# Altium project ISM_SDR_PCB.PrjPcb
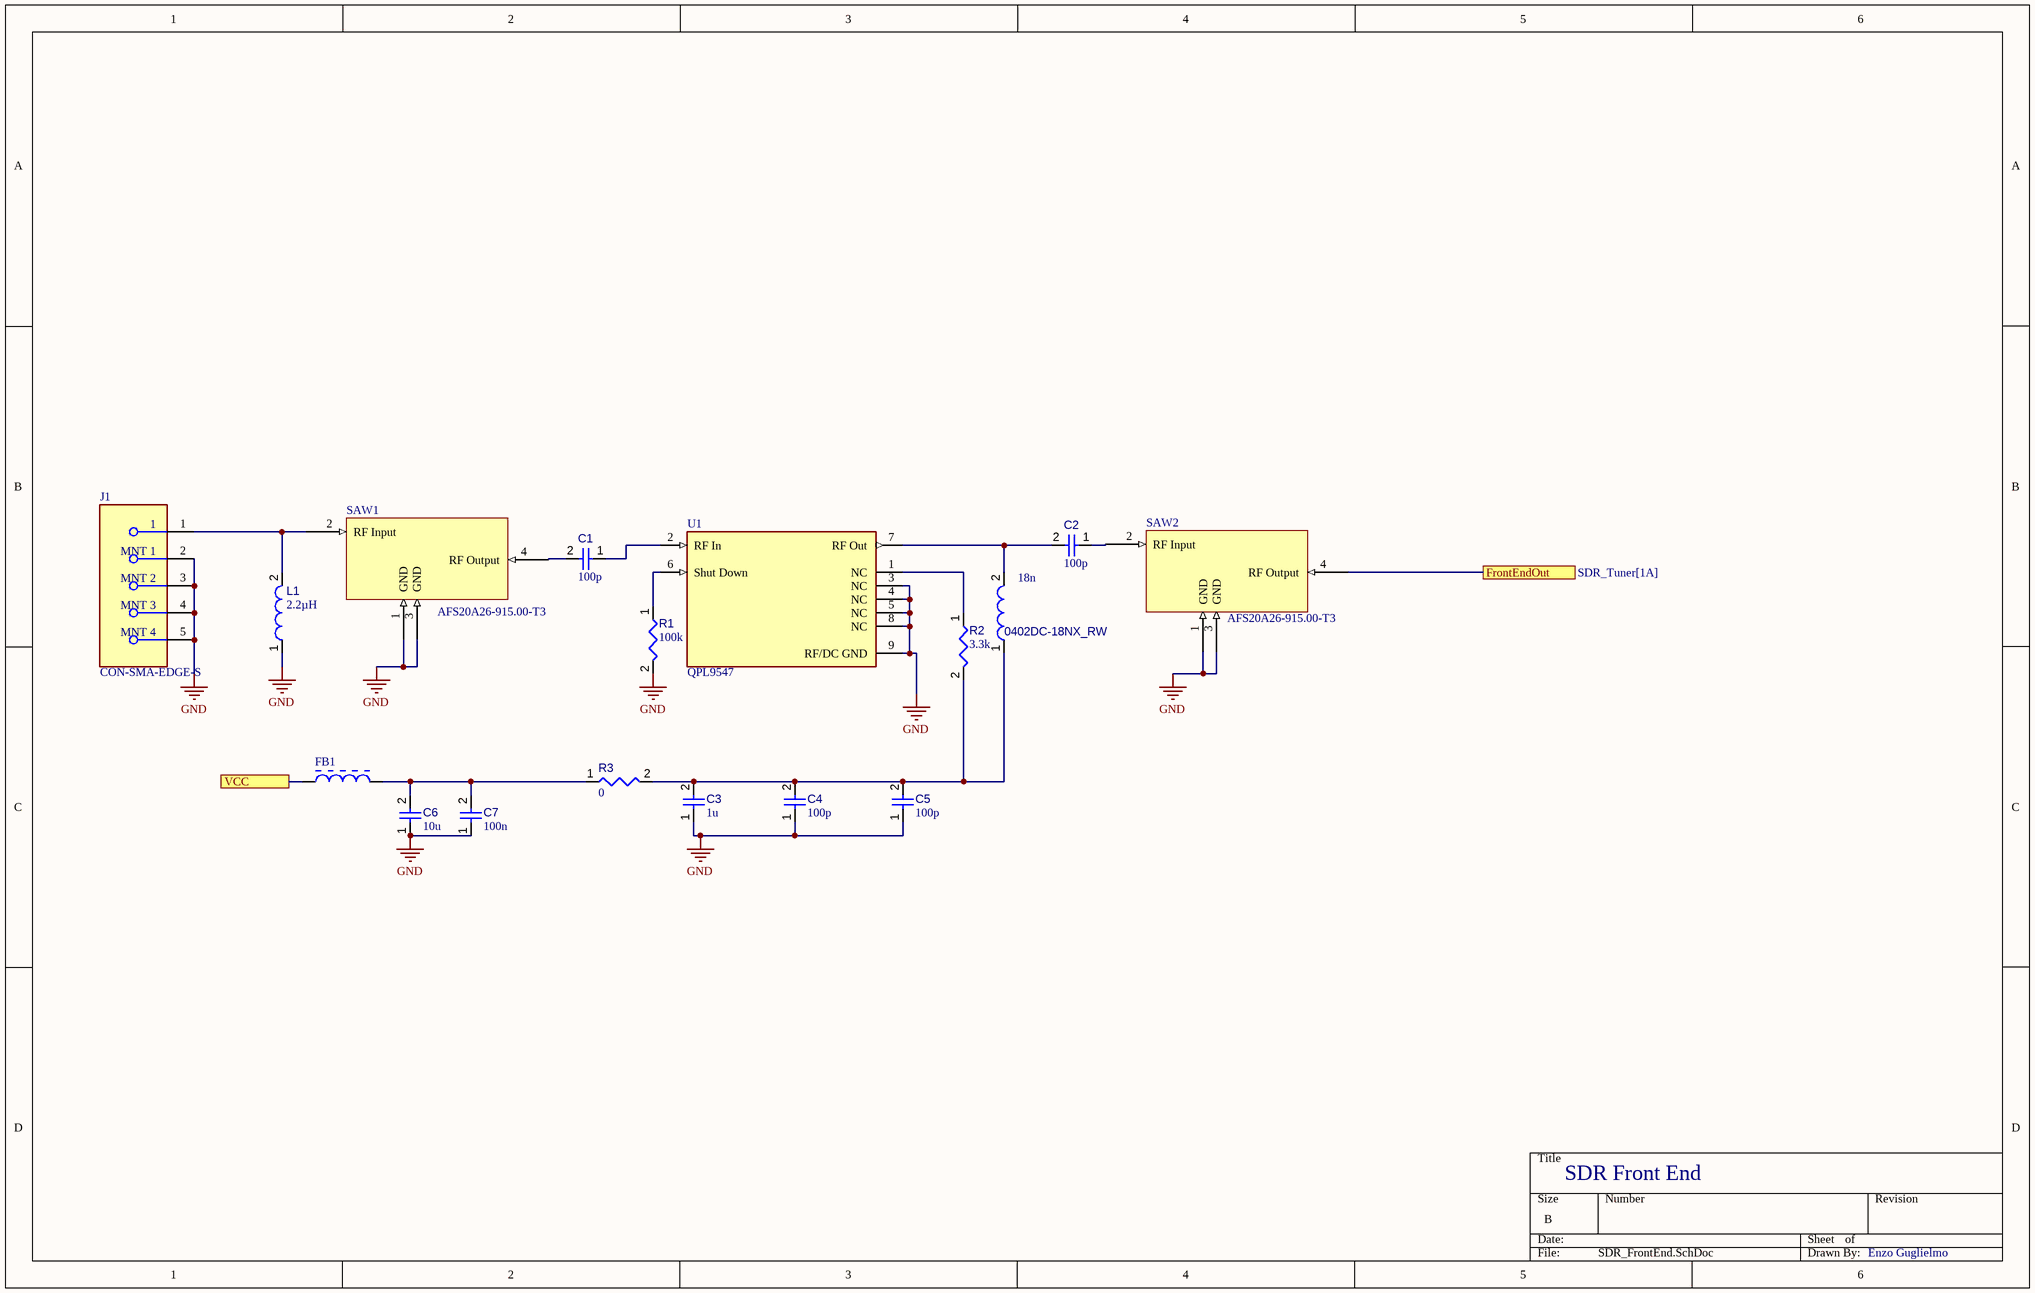
[diagram p0: SDR_FrontEnd.SchDoc]
4 sheets, 139 parts. Net scope: flat (ports and power ports of the same name join across sheets).
Board file: SDR_PCB.PcbDoc
Sheets:
  SDR_FrontEnd.SchDoc
  SDR_LO.SchDoc
  SDR_Tuner.SchDoc
  SDR_Power.SchDoc

## Sheet SDR_FrontEnd.SchDoc
size B; SheetNumber: 1; SheetTotal: 4

### Parts
0402DC-18NX_RW  value 18n  [IND1005X55X20VL5T10]  (hidden comment: ELJ-RF2N2DFB)
C1  value 100p  [CAPC0402(1005)60_L]  (hidden comment: Capacitor 100nF +/-20% 25V 0402)
C2  value 100p  [CAPC0402(1005)60_L]  (hidden comment: Capacitor 100nF +/-20% 25V 0402)
C3  value 1u  [CAPC0402(1005)60_L]  (hidden comment: Capacitor 100nF +/-20% 25V 0402)
C4  value 100p  [CAPC0402(1005)60_L]  (hidden comment: Capacitor 100nF +/-20% 25V 0402)
C5  value 100p  [CAPC0402(1005)60_L]  (hidden comment: Capacitor 100nF +/-20% 25V 0402)
C6  value 10u  [CAPC0402(1005)60_L]  (hidden comment: Capacitor 100nF +/-20% 25V 0402)
C7  value 100n  [CAPC0402(1005)60_L]  (hidden comment: Capacitor 100nF +/-20% 25V 0402)
FB1  BLM21PG331SN1D  [INDC2013X105X50ML20T20]  (value not drawn)
J1  CON-SMA-EDGE-S  [FP-CON-SMA-EDGE-S-MFG]
L1  value 2.2µH  [IND1005X55X20VL5T10]  (hidden comment: ELJ-RF2N2DFB)
R1  value 100k  [RESC1005X40X25ML05T05]  (hidden comment: Resistor 100k +/-1% 0402 63 mW)
R2  value 3.3k  [RESC1005X40X25ML05T05]  (hidden comment: Resistor 100k +/-1% 0402 63 mW)
R3  value 0  [RESC1005X40X25ML05T05]  (hidden comment: Resistor 100k +/-1% 0402 63 mW)
SAW1  AFS20A26-915.00-T3  [AFS20A26-915.00-T3-Footprint-1]
SAW2  AFS20A26-915.00-T3  [AFS20A26-915.00-T3-Footprint-1]
U1  QPL9547  [FP-TQP3M9037-MFG]

### Ports
FrontEndOut (see SDR_Tuner[1A]), VCC (see SDR_Power[1C], SDR_Power[1D], SDR_Power[3A], SDR_Power[3D], SDR_Power[4C], SDR_Tuner[1B])

### Nets
GND: C3.1 C4.1 C5.1 C6.1 C7.1 J1.2(MNT_1) J1.3(MNT_2) J1.4(MNT_3) J1.5(MNT_4) L1.1 R1.2 SAW1.1(GND) SAW1.3(GND) SAW2.1(GND) SAW2.3(GND) U1.3(NC) U1.4(NC) U1.5(NC) U1.8(NC) U1.9(RF/DC_GND)
Net0402DC-18NX_RW_1: 0402DC-18NX_RW.1 C3.2 C4.2 C5.2 R2.2 R3.2
Net0402DC-18NX_RW_2: 0402DC-18NX_RW.2 C2.2 U1.7(RF_Out)
NetC1_1: C1.1 U1.2(RF_In)
NetC1_2: C1.2 SAW1.4(RF_Output)
NetC2_1: C2.1 SAW2.2(RF_Input)
NetC6_2: C6.2 C7.2 FB1.2 R3.1
NetFB1_1: FB1.1 ; port VCC
NetJ1_1: J1.1 L1.2 SAW1.2(RF_Input)
NetR1_1: R1.1 U1.6(Shut_Down)
NetR2_1: R2.1 U1.1(NC)
NetSAW2_4: SAW2.4(RF_Output) ; port FrontEndOut

### Notes on the sheet
- SDR Front End
- Enzo Guglielmo

### Library data of the parts
0402DC-18NX_RW L1 = CMP-006-00006-6: Chip Inductor, 2.2 nH, +/- 0.3 nH, 400 mA, -40 to 85 degC, 0402 (1005 Metric), RoHS, Tape and Reel; Manufacturer: Panasonic; Shielding: Unshielded; Current Rating: 400mA; Tolerance: 5%; Core Material: Ceramic; Q Factor: 8; Datasheet URL: http://www.bourns.com/docs/Product-Datasheets/cm322522.pdf; Case/Package: 0402; RoHS Compliant: True; Package Description: 2-Pin Surface Mount Device, Body 1 x 0.5 mm; Packaging: TapeandReel; Datasheet Version: Sep-12; Package Quantity: 10000; Package Reference: 0402; Min Operating Temperature: -20°C; Mounting Technology: SM; Max Operating Temperature: 85°C
C1-C7 = CMP-001-00065-4: Chip Capacitor, 100nF +/-20%, 25V, 0402, Thickness 0.6 mm; Tolerance: 10%; Max Operating Temperature: 85°C; Min Operating Temperature: -55°C; Pins: 2; Voltage Rating: 25V; Mounting Technology: SMT; Case/Package: 0402
FB1 = CMP-006-00000-3: IND, Chip Ferrite Bead, 330 Ohm, +/- 25%, 1.5 A, -55 to 125 degC, 0805 (2012 Metric), Tape and Reel; Manufacturer: Murata; Current Rating: 1.5A; Impedance: 330Ohm; Resistance: 90mohm; Max Operating Temperature: 125°C; Core Material: Ferrite; Case/Package: 0805; Mounting Technology: SM; Datasheet URL: http://psearch.en.murata.com/inductor/product/LQG15HS15NJ02_.pdf; Packaging: TapeandReel; Min Operating Temperature: -55°C; RoHS Compliant: True; Max Current Rating: 1.5A; Datasheet Version: Nov-11; Package Quantity: 4000; Package Reference: 0805; Package Description: 2-Pin Surface Mount Device, Body 2 x1.25 mm; Tolerance: 25%
J1 = CMP-204357-000001-1: CONN SMA JACK STR EDGE MNT; Manufacturer: RF Solutions Ltd.; Impedance: 50Ω; Conn Orientation: Right Angle; Is Female: yes; Number Of Contacts: 1; Frequency: 18GHz; Shielding: true; Category: Conn; ComponentLink2URL: https://www.rfsolutions.co.uk/downloads/1498648656DS-CON-EDGE-SMA-4.pdf; Octopart: https://octopart.com/con-sma-edge-s-rf+solutions-70967450; Package: CONN_JACK; Manufacturer Part Number: CON-SMA-EDGE-S; Height: 6.35mm; Device Class L1: Connectors; Footprint Url: https://forum.upverter.com/uploads/default/original/3X/b/e/be75b907af57498775929d6d9099689c472e0307.pdf; Contact Material: Gold; ComponentLink2Description: Datasheet; Device Class L2: RF / Coaxial Connectors; RoHS: TRUE; Device Class L3: unset; Digikey Description: CONN SMA JACK STR EDGE MNT; Lead Free: Yes; Automotive: No
R1-R3 = CMP-009-00021-5: Chip Resistor, 100 KOhm, +/- 1%, 0.063 W, -55 to 155 degC, 0402 (1005 Metric); Voltage Rating: 50V; Power: 63mW; Pins: 2; Tolerance: 1%; Max Operating Temperature: 155°C; Case/Package: 0402; Min Operating Temperature: -55°C; Mounting Technology: SM; RoHS Compliant: True
SAW1 SAW2 = CMP-00000-1: Filter Saw 915Mhz 4Smd/Tape & Reel (Tr) Rohs Compliant: Yes; Insertion Loss (dB): 3dB; Number of Circuits: 1; Impedance: 50Ω; Voltage Rating (DC): 3V; Bandwidth: 26MHz; Case/Package: SMD/SMT; Packaging: Tape & Reel (TR); Min Operating Temperature: -30°C; Number of Terminals: 4; Length: 2mm; Mounting Technology: Surface Mount; RoHS: Compliant; Termination: SMD/SMT; Max Operating Temperature: 85°C; Height: 900µm; Frequency: 915MHz; Introduction Date: 2013-01-22; Width: 1.6mm; Cutoff Frequency: 915MHz; REACH SVHC: Unaffected; China RoHS: Compliant; Lifecycle Status: Production
U1 = CMP-231850-000001-1: RF Amp Chip Single GP 2.7GHz 5.25V 8-Pin DFN EP T/R; LCSC: C5185128

## Sheet SDR_LO.SchDoc
size B; SheetNumber: 2; SheetTotal: 4
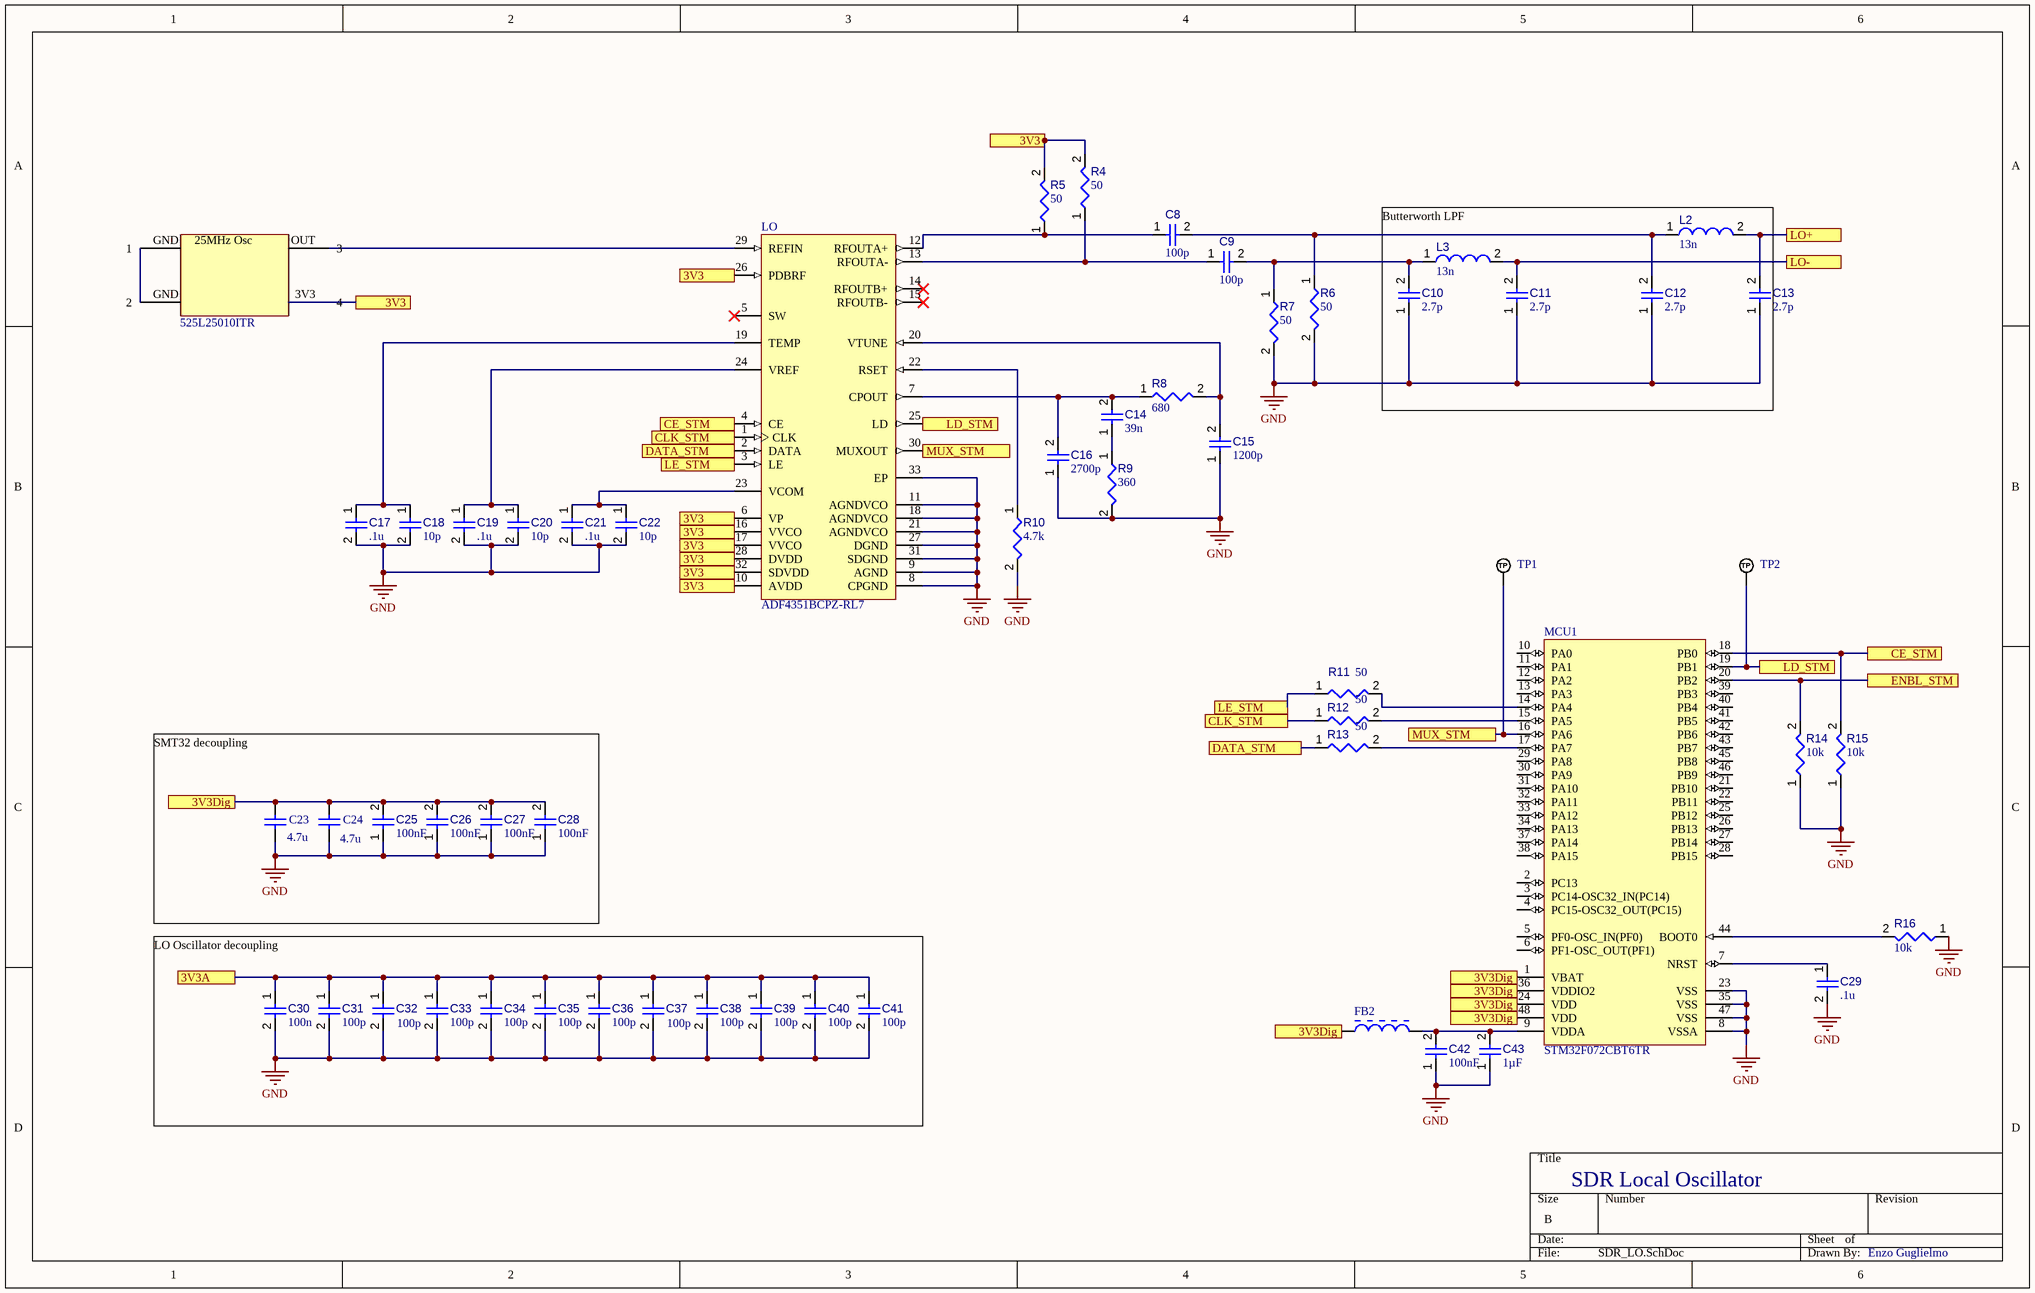
[diagram p1: SDR_LO.SchDoc]

### Parts
*  525L25010ITR
C8  value 100p  [CAPC0402(1005)60_L]  (hidden comment: Capacitor 100nF +/-20% 25V 0402)
C9  value 100p  [CAPC0402(1005)60_L]  (hidden comment: Capacitor 100nF +/-20% 25V 0402)
C10  value 2.7p  [CAPC0402(1005)60_L]  (hidden comment: Capacitor 100nF +/-20% 25V 0402)
C11  value 2.7p  [CAPC0402(1005)60_L]  (hidden comment: Capacitor 100nF +/-20% 25V 0402)
C12  value 2.7p  [CAPC0402(1005)60_L]  (hidden comment: Capacitor 100nF +/-20% 25V 0402)
C13  value 2.7p  [CAPC0402(1005)60_L]  (hidden comment: Capacitor 100nF +/-20% 25V 0402)
C14  value 39n  [CAPC0402(1005)60_L]  (hidden comment: Capacitor 100nF +/-20% 25V 0402)
C15  value 1200p  [CAPC0402(1005)60_L]  (hidden comment: Capacitor 100nF +/-20% 25V 0402)
C16  value 2700p  [CAPC0402(1005)60_L]  (hidden comment: Capacitor 100nF +/-20% 25V 0402)
C17  value .1u  [CAPC0402(1005)60_L]  (hidden comment: Capacitor 100nF +/-20% 25V 0402)
C18  value 10p  [CAPC0402(1005)60_L]  (hidden comment: Capacitor 100nF +/-20% 25V 0402)
C19  value .1u  [CAPC0402(1005)60_L]  (hidden comment: Capacitor 100nF +/-20% 25V 0402)
C20  value 10p  [CAPC0402(1005)60_L]  (hidden comment: Capacitor 100nF +/-20% 25V 0402)
C21  value .1u  [CAPC0402(1005)60_L]  (hidden comment: Capacitor 100nF +/-20% 25V 0402)
C22  value 10p  [CAPC0402(1005)60_L]  (hidden comment: Capacitor 100nF +/-20% 25V 0402)
C23  4.7u  [WCAP-CSGP_0402_L1W0.5H0.5]
C24  4.7u  [WCAP-CSGP_0402_L1W0.5H0.5]
C25  value 100nF  [CAPC0402(1005)60_L]  (hidden comment: Capacitor 100nF +/-20% 10V 0402)
C26  value 100nF  [CAPC0402(1005)60_L]  (hidden comment: Capacitor 100nF +/-20% 10V 0402)
C27  value 100nF  [CAPC0402(1005)60_L]  (hidden comment: Capacitor 100nF +/-20% 10V 0402)
C28  value 100nF  [CAPC0402(1005)60_L]  (hidden comment: Capacitor 100nF +/-20% 10V 0402)
C29  value .1u  [CAPC0402(1005)60_L]  (hidden comment: Capacitor 100nF +/-20% 25V 0402)
C30  value 100n  [CAPC0402(1005)60_L]  (hidden comment: Capacitor 100nF +/-20% 25V 0402)
C31  value 100p  [CAPC0402(1005)60_L]  (hidden comment: Capacitor 100nF +/-20% 25V 0402)
C32  value 100p  [CAPC0402(1005)60_L]  (hidden comment: Capacitor 100nF +/-20% 25V 0402)
C33  value 100p  [CAPC0402(1005)60_L]  (hidden comment: Capacitor 100nF +/-20% 25V 0402)
C34  value 100p  [CAPC0402(1005)60_L]  (hidden comment: Capacitor 100nF +/-20% 25V 0402)
C35  value 100p  [CAPC0402(1005)60_L]  (hidden comment: Capacitor 100nF +/-20% 25V 0402)
C36  value 100p  [CAPC0402(1005)60_L]  (hidden comment: Capacitor 100nF +/-20% 25V 0402)
C37  value 100p  [CAPC0402(1005)60_L]  (hidden comment: Capacitor 100nF +/-20% 25V 0402)
C38  value 100p  [CAPC0402(1005)60_L]  (hidden comment: Capacitor 100nF +/-20% 25V 0402)
C39  value 100p  [CAPC0402(1005)60_L]  (hidden comment: Capacitor 100nF +/-20% 25V 0402)
C40  value 100p  [CAPC0402(1005)60_L]  (hidden comment: Capacitor 100nF +/-20% 25V 0402)
C41  value 100p  [CAPC0402(1005)60_L]  (hidden comment: Capacitor 100nF +/-20% 25V 0402)
C42  value 100nF  [CAPC0402(1005)60_L]  (hidden comment: Capacitor 100nF +/-20% 10V 0402)
C43  value 1µF  [CAPC0402(1005)60_L]  (hidden comment: Capacitor 1µF +/-20% 10V 0402)
FB2  BLM21PG331SN1D  [INDC2013X105X50ML20T20]  (value not drawn)
L2  value 13n  [IND1005X55X20VL5T10]  (hidden comment: ELJ-RF2N2DFB)
L3  value 13n  [IND1005X55X20VL5T10]  (hidden comment: ELJ-RF2N2DFB)
LO  ADF4351BCPZ-RL7  [ADI-CP-32-2_L]
MCU1  STM32F072CBT6TR  [STM-LQFP48_M]
R4  value 50  [RESC1005X40X25ML05T05]  (hidden comment: Resistor 100k +/-1% 0402 63 mW)
R5  value 50  [RESC1005X40X25ML05T05]  (hidden comment: Resistor 100k +/-1% 0402 63 mW)
R6  value 50  [RESC1005X40X25ML05T05]  (hidden comment: Resistor 100k +/-1% 0402 63 mW)
R7  value 50  [RESC1005X40X25ML05T05]  (hidden comment: Resistor 100k +/-1% 0402 63 mW)
R8  value 680  [RESC1005X40X25ML05T05]  (hidden comment: Resistor 100k +/-1% 0402 63 mW)
R9  value 360  [RESC1005X40X25ML05T05]  (hidden comment: Resistor 100k +/-1% 0402 63 mW)
R10  value 4.7k  [RESC1005X40X25ML05T05]  (hidden comment: Resistor 100k +/-1% 0402 63 mW)
R11  value 50  [RESC1005X40X25ML05T05]  (hidden comment: Resistor 100k +/-1% 0402 63 mW)
R12  value 50  [RESC1005X40X25ML05T05]  (hidden comment: Resistor 100k +/-1% 0402 63 mW)
R13  value 50  [RESC1005X40X25ML05T05]  (hidden comment: Resistor 100k +/-1% 0402 63 mW)
R14  value 10k  [RESC1005X40X25ML05T05]  (hidden comment: Resistor 100k +/-1% 0402 63 mW)
R15  value 10k  [RESC1005X40X25ML05T05]  (hidden comment: Resistor 100k +/-1% 0402 63 mW)
R16  value 10k  [RESC1005X40X25ML05T05]  (hidden comment: Resistor 100k +/-1% 0402 63 mW)
TP1  TP_NOBOM  [PAD_RND_1MM]  (value not drawn)  (no BOM)
TP2  TP_NOBOM  [PAD_RND_1MM]  (value not drawn)  (no BOM)

### Ports
3V3 (see SDR_LO[2A], SDR_LO[3A], SDR_LO[3B]), 3V3 (see SDR_LO[3A], SDR_LO[3B]), 3V3A (see SDR_Power[2C]), 3V3Dig (see SDR_LO[1C], SDR_LO[4D], SDR_LO[5D], SDR_Power[2D]), 3V3Dig (see SDR_LO[1C], SDR_LO[5D], SDR_Power[2D]), 3V3Dig (see SDR_LO[4D], SDR_LO[5D], SDR_Power[2D]), CE_STM (see SDR_LO[2B]), CE_STM (see SDR_LO[6C]), CLK_STM (see SDR_LO[2B]), CLK_STM (see SDR_LO[4C]), DATA_STM (see SDR_LO[2B]), DATA_STM (see SDR_LO[4C]), ENBL_STM (see SDR_Tuner[3A]), LD_STM (see SDR_LO[3B]), LD_STM (see SDR_LO[6C]), LE_STM (see SDR_LO[2B]), LE_STM (see SDR_LO[4C]), LO+ (see SDR_Tuner[3A]), LO- (see SDR_Tuner[3A]), MUX_STM (see SDR_LO[3B]), MUX_STM (see SDR_LO[5C])

### Nets
GND: C10.1 C11.1 C12.1 C13.1 C15.1 C16.1 C17.2 C18.2 C19.2 C20.2 C21.2 C22.2 C23.1 C24.1 C25.1 C26.1 C27.1 C28.1 C29.2 C30.2 C31.2 C32.2 C33.2 C34.2 C35.2 C36.2 C37.2 C38.2 C39.2 C40.2 C41.2 C42.1 C43.1 LO.8(CPGND) LO.9(AGND) LO.11(AGNDVCO) LO.18(AGNDVCO) LO.21(AGNDVCO) LO.27(DGND) LO.31(SDGND) LO.33(EP) MCU1.8(VSSA) MCU1.23(VSS) MCU1.35(VSS) MCU1.47(VSS) R6.2 R7.2 R9.2 R10.2 R14.1 R15.1 R16.1
Net*_3V3: *.3V3(4) LO.6(VP) LO.10(AVDD) LO.16(VVCO) LO.17(VVCO) LO.26(PDBRF) LO.28(DVDD) LO.32(SDVDD) R4.2 R5.2 ; port 3V3
NetC8_1: C8.1 LO.12(RFOUTA+) R5.1
NetC8_2: C8.2 C12.2 L2.1 R6.1
NetC9_1: C9.1 LO.13(RFOUTA-) R4.1
NetC9_2: C9.2 C10.2 L3.1 R7.1
NetC11_2: C11.2 L3.2 ; port LO-
NetC13_2: C13.2 L2.2 ; port LO+
NetC14_1: C14.1 R9.1
NetC14_2: C14.2 C16.2 LO.7(CPOUT) R8.1
NetC15_2: C15.2 LO.20(VTUNE) R8.2
NetC17_1: C17.1 C18.1 LO.19(TEMP)
NetC19_1: C19.1 C20.1 LO.24(VREF)
NetC21_1: C21.1 C22.1 LO.23(VCOM)
NetC23_2: C23.2 C24.2 C25.2 C26.2 C27.2 C28.2 FB2.1 MCU1.1(VBAT) MCU1.24(VDD) MCU1.36(VDDIO2) MCU1.48(VDD) ; port 3V3Dig
NetC29_1: C29.1 MCU1.7(NRST)
NetC30_1: C30.1 C31.1 C32.1 C33.1 C34.1 C35.1 C36.1 C37.1 C38.1 C39.1 C40.1 C41.1 ; port 3V3A
NetC42_2: C42.2 C43.2 FB2.2 MCU1.9(VDDA)
NetLO_1: LO.1(CLK) R12.1 ; port CLK_STM
NetLO_2: LO.2(DATA) R13.1 ; port DATA_STM
NetLO_3: LO.3(LE) R11.1 ; port LE_STM
NetLO_4: LO.4(CE) MCU1.18(PB0) R15.2 ; port CE_STM
NetLO_22: LO.22(RSET) R10.1
NetLO_25: LO.25(LD) MCU1.19(PB1) TP2.1(TP) ; port LD_STM
NetLO_30: LO.30(MUXOUT) MCU1.16(PA6) TP1.1(TP) ; port MUX_STM
NetMCU1_14: MCU1.14(PA4) R11.2
NetMCU1_15: MCU1.15(PA5) R12.2
NetMCU1_17: MCU1.17(PA7) R13.2
NetMCU1_20: MCU1.20(PB2) R14.2 ; port ENBL_STM
NetMCU1_44: MCU1.44(BOOT0) R16.2

Not connected (* = marked no-connect by the designer): * GND(2) OUT(3); LO 5(SW)* 14(RFOUTB+)* 15(RFOUTB-)* 29(REFIN); MCU1 2(PC13) 3(PC14-OSC32_IN(PC14)) 4(PC15-OSC32_OUT(PC15)) 5(PF0-OSC_IN(PF0)) 6(PF1-OSC_OUT(PF1)) 10(PA0) 11(PA1) 12(PA2) 13(PA3) 21(PB10) 22(PB11) 25(PB12) 26(PB13) 27(PB14) 28(PB15) 29(PA8) 30(PA9) 31(PA10) 32(PA11) 33(PA12) 34(PA13) 37(PA14) 38(PA15) 39(PB3) 40(PB4) 41(PB5) 42(PB6) 43(PB7) 45(PB8) 46(PB9)

### Notes on the sheet
- Butterworth LPF
- SMT32 decoupling
- LO Oscillator decoupling
- SDR Local Oscillator
- Enzo Guglielmo
- (in symbol 525L25010ITR) 25MHz Osc

### Library data of the parts
* = 525L25010ITR: 25 MHz TCXO Clipped Sine Wave Oscillator 3.3V 4-SMD, No Lead
C8-C22 C29-C41 = CMP-001-00065-4: as C1 on sheet SDR_FrontEnd; Max Operating Temperature: 85°C; Min Operating Temperature: -55°C; Pins: 2; Voltage Rating: 25V; Mounting Technology: SMT; Case/Package: 0402
C23 C24 = CMP-207839-000027-3: Cap, Mlcc, 4.7UF, 6.3V, X5R, 0402 Rohs Compliant: Yes; Insulation Resistance: 20MΩ; Capacitance: 4.7µF; Material: Ceramic; Tolerance: 20%; Case Code (Metric): 1005; Case/Package: 0402; Case Code (Imperial): 0402; RoHS: Compliant; Voltage Rating (DC): 6.3V; Thickness: 558.8µm; Dielectric: X5R; REACH SVHC: Unknown; Voltage Rating: 6.3V; Width: 500µm; Max Operating Temperature: 85°C; Height: 500µm; Mount: Surface Mount; Min Operating Temperature: -55°C; Length: 1mm
C25-C28 C42 = CMP-001-00061-3: Chip Capacitor, 100nF +/-20%, 10V, 0402, Thickness 0.6 mm; Tolerance: 20%; Mounting Technology: SMT; Voltage Rating: 10V; Max Operating Temperature: 85°C; Pins: 2; Case/Package: 0402; Min Operating Temperature: -55°C
C43 = CMP-001-00063-3: Chip Capacitor, 1µF +/-20%, 10V, 0402, Thickness 0.6 mm; Tolerance: 10%; Mounting Technology: SMT; Max Operating Temperature: 85°C; Voltage Rating: 10V; Pins: 2; Case/Package: 0402; Min Operating Temperature: -55°C
FB2 = CMP-006-00000-3: as FB1 on sheet SDR_FrontEnd; Max Operating Temperature: 125°C; Core Material: Ferrite; Case/Package: 0805; Mounting Technology: SM; Datasheet URL: http://psearch.en.murata.com/inductor/product/LQG15HS15NJ02_.pdf; Packaging: TapeandReel; Min Operating Temperature: -55°C; RoHS Compliant: True; Max Current Rating: 1.5A; Datasheet Version: Nov-11; Package Quantity: 4000; Package Reference: 0805; Package Description: 2-Pin Surface Mount Device, Body 2 x1.25 mm; Tolerance: 25%
L2 L3 = CMP-006-00006-6: as 0402DC-18NX_RW on sheet SDR_FrontEnd; Datasheet URL: http://www.bourns.com/docs/Product-Datasheets/cm322522.pdf; Case/Package: 0402; RoHS Compliant: True; Package Description: 2-Pin Surface Mount Device, Body 1 x 0.5 mm; Packaging: TapeandReel; Datasheet Version: Sep-12; Package Quantity: 10000; Package Reference: 0402; Min Operating Temperature: -20°C; Mounting Technology: SM; Max Operating Temperature: 85°C
LO = CMP-0287-00015-1: Wideband Synthesizer with Integrated VCO, CP-32-2, Pb-Free, 1500 Reel; Max RF Input (MHz): 4.4GHz; RF Prescalers: 4/5,8/9; Max REFin (MHz): 250MHz; Frequency Range: 35MHz-4.4GHz; Norm Phase Noise (dBc/Hz): -221dBc; Supply Current: 110mA; Single/Dual: Single; PackageVersion: Jan-2005; ComponentLink3URL: http://www.analog.com/static/imported-files/packages/414143737956480539664569CP_32_2.pdf; PackageReference: CP-32-2; ComponentLink2URL: http://www.analog.com/static/imported-files/data_sheets/ADF4351.pdf; ComponentLink1URL: www.analog.com; ComponentLink1Description: Manufacturer URL; ComponentLink2Description: Datasheet; ComponentLink3Description: Package Specification; PackageDescription: 32-Lead Lead Frame Chip Scale Package [LFCSP_VQ]; DatasheetVersion: Rev. Pr D; Code_JEDEC: MO-220-VHHD-2
MCU1 = CMP-0304-00171-1: ARM Cortex-M0 32-bit MCU, 128 KB Flash, 16 KB Internal RAM, 37 I/Os, 48-Pin LQFP, -40 to 85 degC, Tape and Reel; FLASH Size (Prog) (kB): 128; D/A Converter: 1; Operating Frequency(F) (Processor speed) (MHz): 48; Supply Voltage(Vcc) min (V): 2; I/Os (High Current): 37; Internal RAM Size (kB): 16; ComponentLink1URL: http://www.st.com/; DatasheetVersion: Rev. 5; Mounting Technology: Surface Mount; Packing: Tape and Reel; ComponentLink2Description: Datasheet; ComponentLink2URL: http://www.st.com/st-web-ui/static/active/en/resource/technical/document/datasheet/DM00090510.pdf; ComponentLink1Description: Manufacturer URL; Package Reference: LQFP48; Core: ARM Cortex-M0; Package Description: 48-Pin Low Profile Quad Flat Package, Body 7 x 7 mm, Pitch 0.5 mm
R4-R16 = CMP-009-00021-5: as R1 on sheet SDR_FrontEnd; Pins: 2; Tolerance: 1%; Max Operating Temperature: 155°C; Case/Package: 0402; Min Operating Temperature: -55°C; Mounting Technology: SM; RoHS Compliant: True
TP1 TP2 = TEST_POINT_RND_1MM: Test Point Round 1mm (NO BOM)

## Sheet SDR_Tuner.SchDoc
size B; SheetNumber: 3; SheetTotal: 4
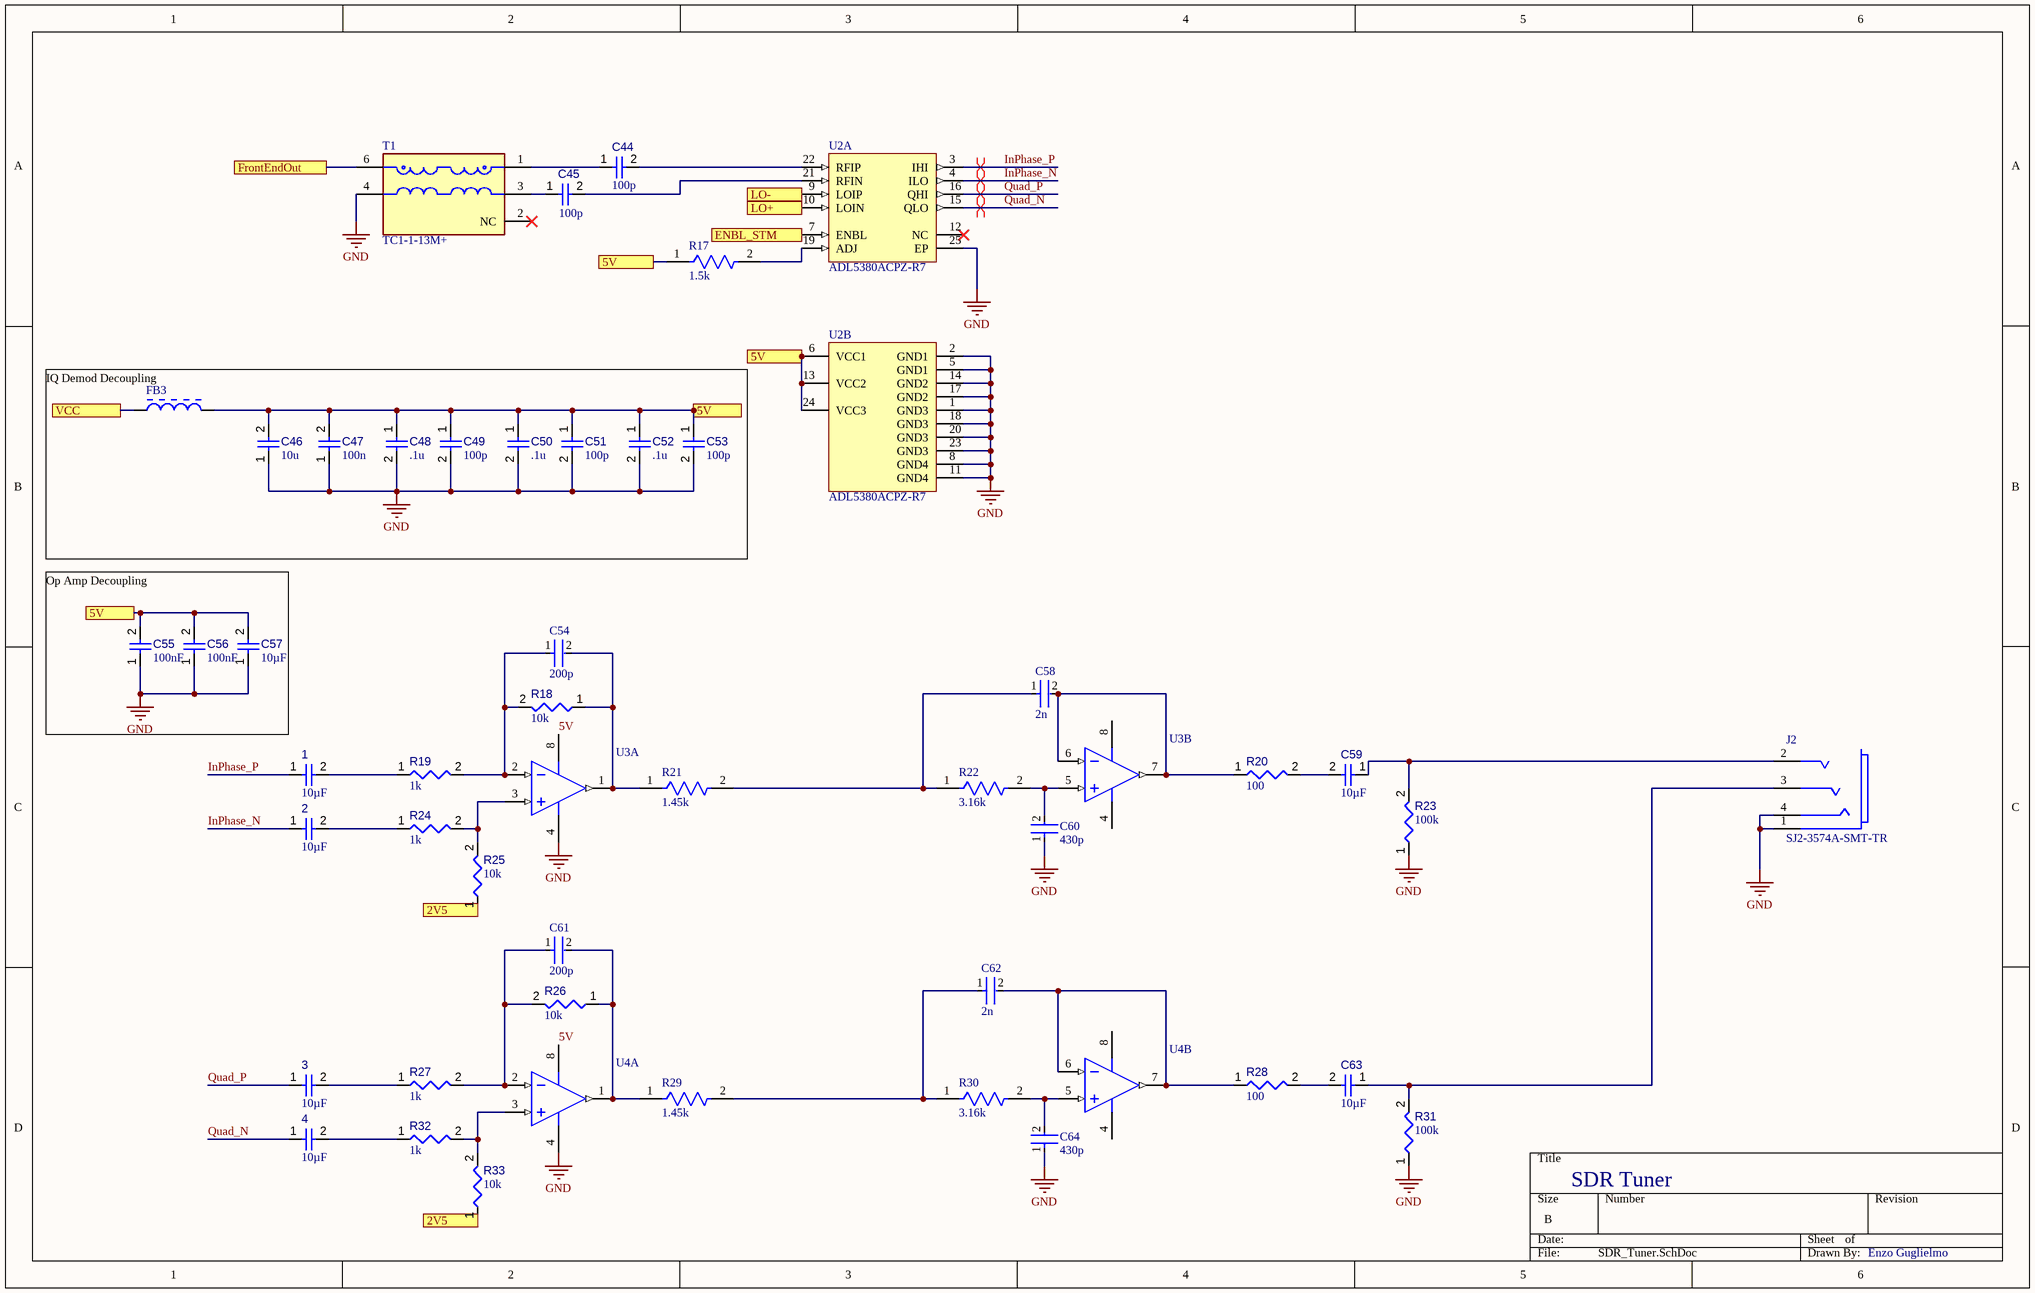
[diagram p2: SDR_Tuner.SchDoc]

### Parts
1  value 10µF  [CAPC0603(1608)100_L]  (hidden comment: Capacitor 10µF +/-20% 10V 0603)
2  value 10µF  [CAPC0603(1608)100_L]  (hidden comment: Capacitor 10µF +/-20% 10V 0603)
3  value 10µF  [CAPC0603(1608)100_L]  (hidden comment: Capacitor 10µF +/-20% 10V 0603)
4  value 10µF  [CAPC0603(1608)100_L]  (hidden comment: Capacitor 10µF +/-20% 10V 0603)
C44  value 100p  [CAPC0402(1005)60_L]  (hidden comment: Capacitor 100nF +/-20% 25V 0402)
C45  value 100p  [CAPC0402(1005)60_L]  (hidden comment: Capacitor 100nF +/-20% 25V 0402)
C46  value 10u  [CAPC0402(1005)60_L]  (hidden comment: Capacitor 100nF +/-20% 25V 0402)
C47  value 100n  [CAPC0402(1005)60_L]  (hidden comment: Capacitor 100nF +/-20% 25V 0402)
C48  value .1u  [CAPC0402(1005)60_L]  (hidden comment: Capacitor 100nF +/-20% 25V 0402)
C49  value 100p  [CAPC0402(1005)60_L]  (hidden comment: Capacitor 100nF +/-20% 25V 0402)
C50  value .1u  [CAPC0402(1005)60_L]  (hidden comment: Capacitor 100nF +/-20% 25V 0402)
C51  value 100p  [CAPC0402(1005)60_L]  (hidden comment: Capacitor 100nF +/-20% 25V 0402)
C52  value .1u  [CAPC0402(1005)60_L]  (hidden comment: Capacitor 100nF +/-20% 25V 0402)
C53  value 100p  [CAPC0402(1005)60_L]  (hidden comment: Capacitor 100nF +/-20% 25V 0402)
C54  200p  [FP-GCM155-0_05-IPC_A]
C55  value 100nF  [CAPC0402(1005)60_L]  (hidden comment: Capacitor 100nF +/-20% 10V 0402)
C56  value 100nF  [CAPC0402(1005)60_L]  (hidden comment: Capacitor 100nF +/-20% 10V 0402)
C57  value 10µF  [CAPC0402(1005)60_L]  (hidden comment: Capacitor 10µF +/-40% 6.3V 0402)
C58  2n  [FP-GRM188-0_1-e0_2_0_5-IPC_B]
C59  value 10µF  [CAPC0402(1005)60_L]  (hidden comment: Capacitor 10µF +/-40% 6.3V 0402)
C60  430p  [FP-GCM155-0_05-MFG]
C61  200p  [FP-GCM155-0_05-IPC_A]
C62  2n  [FP-GRM188-0_1-e0_2_0_5-IPC_B]
C63  value 10µF  [CAPC0402(1005)60_L]  (hidden comment: Capacitor 10µF +/-40% 6.3V 0402)
C64  430p  [FP-GCM155-0_05-MFG]
FB3  BLM21PG331SN1D  [INDC2013X105X50ML20T20]  (value not drawn)
J2  SJ2-3574A-SMT-TR  [FP-SJ2-3574A-SMT-TR-MFG]
R17  1.5k  [FP-RN73R1E-MFG]
R18  value 10k  [RESC0402(1005)_L]  (hidden comment: Resistor 10K  +/-1 % 0402 63 mW)
R19  value 1k  [RESC0402(1005)_L]  (hidden comment: Resistor 1K +/-5 % 0402 63 mW)
R20  value 100  [RESC0402(1005)_L]  (hidden comment: 100R2F)
R21  1.45k  [FP-RN73R1E-IPC_B]
R22  3.16k  [FP-RN73R1E-IPC_B]
R23  value 100k  [RESC0402(1005)_L]  (hidden comment: 100KR2F)
R24  value 1k  [RESC0402(1005)_L]  (hidden comment: Resistor 1K +/-5 % 0402 63 mW)
R25  value 10k  [RESC0402(1005)_L]  (hidden comment: Resistor 10K  +/-1 % 0402 63 mW)
R26  value 10k  [RESC0402(1005)_L]  (hidden comment: Resistor 10K  +/-1 % 0402 63 mW)
R27  value 1k  [RESC0402(1005)_L]  (hidden comment: Resistor 1K +/-5 % 0402 63 mW)
R28  value 100  [RESC0402(1005)_L]  (hidden comment: 100R2F)
R29  1.45k  [FP-RN73R1E-IPC_B]
R30  3.16k  [FP-RN73R1E-IPC_B]
R31  value 100k  [RESC0402(1005)_L]  (hidden comment: 100KR2F)
R32  value 1k  [RESC0402(1005)_L]  (hidden comment: Resistor 1K +/-5 % 0402 63 mW)
R33  value 10k  [RESC0402(1005)_L]  (hidden comment: Resistor 10K  +/-1 % 0402 63 mW)
T1  TC1-1-13M+  [FP-TC1-1-13M+-MFG]
U2  ADL5380ACPZ-R7  [ADI-CP-24-3_N]  (parts A,B of 2)
U3  LT6203CMS8#TRPBF  [LT-MS8-8_L]  (value not drawn)  (parts A,B of 2)
U4  LT6203CMS8#TRPBF  [LT-MS8-8_L]  (value not drawn)  (parts A,B of 2)

### Ports
2V5 (see SDR_Power[4D], SDR_Tuner[2C]), 2V5 (see SDR_Power[4D], SDR_Tuner[2D]), 5V (see SDR_Tuner[1B], SDR_Tuner[2A], SDR_Tuner[3B]), 5V (see SDR_Tuner[1B], SDR_Tuner[3B]), 5V (see SDR_Tuner[2A], SDR_Tuner[3B]), ENBL_STM (see SDR_LO[6C]), FrontEndOut (see SDR_FrontEnd[5B]), LO+ (see SDR_LO[6A]), LO- (see SDR_LO[6A]), VCC (see SDR_FrontEnd[1C], SDR_Power[1C], SDR_Power[1D], SDR_Power[3A], SDR_Power[3D], SDR_Power[4C])

### Nets
GND: C46.1 C47.1 C48.2 C49.2 C50.2 C51.2 C52.2 C53.2 C55.1 C56.1 C57.1 C60.1 C64.1 J2.1(sleeve) J2.4(ring_2) R23.1 R31.1 T1.4(PRIMARY) U2.1(GND3) U2.2(GND1) U2.5(GND1) U2.8(GND4) U2.11(GND4) U2.14(GND2) U2.17(GND2) U2.18(GND3) U2.20(GND3) U2.23(GND3) U2.25(EP) U3.4(V-) U4.4(V-)
5V: U3.8(V+) U4.8(V+)
InPhase_N: 2.1 U2.4(ILO)
InPhase_P: 1.1 U2.3(IHI)
Quad_N: 4.1 U2.15(QLO)
Quad_P: 3.1 U2.16(QHI)
Net1_2: 1.2 R19.1
Net2_2: 2.2 R24.1
Net3_2: 3.2 R27.1
Net4_2: 4.2 R32.1
NetC11_2: U2.9(LOIP) ; port LO-
NetC13_2: U2.10(LOIN) ; port LO+
NetC44_1: C44.1 T1.1(SECONDARY_DOT)
NetC44_2: C44.2 U2.22(RFIP)
NetC45_1: C45.1 T1.3(SECONDARY)
NetC45_2: C45.2 U2.21(RFIN)
NetC46_2: C46.2 C47.2 C48.1 C49.1 C50.1 C51.1 C52.1 C53.1 C55.2 C56.2 C57.2 FB3.2 R17.1 U2.6(VCC1) U2.13(VCC2) U2.24(VCC3) ; port 5V
NetC54_1: C54.1 R18.2 R19.2 U3.2(-IN_A)
NetC54_2: C54.2 R18.1 R21.1 U3.1(OUT_A)
NetC58_1: C58.1 R21.2 R22.1
NetC58_2: C58.2 R20.1 U3.6(-IN_B) U3.7(OUT_B)
NetC59_1: C59.1 J2.2(tip) R23.2
NetC59_2: C59.2 R20.2
NetC60_2: C60.2 R22.2 U3.5(+IN_B)
NetC61_1: C61.1 R26.2 R27.2 U4.2(-IN_A)
NetC61_2: C61.2 R26.1 R29.1 U4.1(OUT_A)
NetC62_1: C62.1 R29.2 R30.1
NetC62_2: C62.2 R28.1 U4.6(-IN_B) U4.7(OUT_B)
NetC63_1: C63.1 J2.3(ring_1) R31.2
NetC63_2: C63.2 R28.2
NetC64_2: C64.2 R30.2 U4.5(+IN_B)
NetFB1_1: FB3.1 ; port VCC
NetMCU1_20: U2.7(ENBL) ; port ENBL_STM
NetR17_2: R17.2 U2.19(ADJ)
NetR24_2: R24.2 R25.2 U3.3(+IN_A)
NetR25_1: R25.1 R33.1 ; port 2V5
NetR32_2: R32.2 R33.2 U4.3(+IN_A)
NetSAW2_4: T1.6(PRIMARY_DOT) ; port FrontEndOut

Not connected (* = marked no-connect by the designer): T1 2(NC)*; U2 12(NC)*

### Layout directives
differential pair: InPhase_N, InPhase_P, Quad_N, Quad_P

### Notes on the sheet
- IQ Demod Decoupling
- Op Amp Decoupling
- SDR Tuner
- Enzo Guglielmo

### Library data of the parts
1-4 = CMP-001-00075-4: Chip Capacitor, 10µF +/-20%, 10V, 0603, Thickness 1 mm; Tolerance: 10%; Voltage Rating: 10V; Max Operating Temperature: 85°C; Pins: 2; Case/Package: 0603; Mounting Technology: SMT; Min Operating Temperature: -55°C
C44-C53 = CMP-001-00065-4: as C1 on sheet SDR_FrontEnd; Max Operating Temperature: 85°C; Min Operating Temperature: -55°C; Pins: 2; Voltage Rating: 25V; Mounting Technology: SMT; Case/Package: 0402
C54 C61 = CMP-06035-011527-1: Ceramic Capacitor for Automotive 200pF ±1% 50VDC C0G 0402 Paper T/R
C55 C56 = CMP-001-00061-3: as C25 on sheet SDR_LO; Mounting Technology: SMT; Voltage Rating: 10V; Max Operating Temperature: 85°C; Pins: 2; Case/Package: 0402; Min Operating Temperature: -55°C
C57 C59 C63 = CMP-001-00074-3: Chip Capacitor, 10µF +/-40%, 6.3V, 0402, Thickness 0.6 mm; Tolerance: 10%; Case/Package: 0402; Pins: 2; Mounting Technology: SMT; Voltage Rating: 6.3V; Max Operating Temperature: 85°C; Min Operating Temperature: -55°C
C58 C62 = CMP-2006-02494-2: Chip Multilayer Ceramic Capacitors for General Purpose, 0603, 2000pF, C0G, 30ppm/°C, 5%, 50V; Capacitance: 2nF; Voltage Rating (DC): 50V; Depth: 0.8mm; Material: Ceramic; Package Quantity: 1; Packaging: Tape and Reel; Case Code (Imperial): 0603; Termination: SMD/SMT; Min Operating Temperature: -55°C; Dielectric: C0G; Tolerance: 5%; Case/Package: 0603; REACH SVHC: No SVHC; Max Operating Temperature: 125°C; Length: 1.6mm; Case Code (Metric): 1608; Voltage: 50V; Lead Free: Lead Free; Thickness: 0.035inch; Height: 0.8mm; Mount: Surface Mount; Radiation Hardening: No; Voltage Rating: 50V; Width: 0.8mm
C60 C64 = CMP-06035-017991-1: Ceramic Capacitor for Automotive 430pF ±1% 50VDC C0G 0402 Paper T/R
FB3 = CMP-006-00000-3: as FB1 on sheet SDR_FrontEnd; Max Operating Temperature: 125°C; Core Material: Ferrite; Case/Package: 0805; Mounting Technology: SM; Datasheet URL: http://psearch.en.murata.com/inductor/product/LQG15HS15NJ02_.pdf; Packaging: TapeandReel; Min Operating Temperature: -55°C; RoHS Compliant: True; Max Current Rating: 1.5A; Datasheet Version: Nov-11; Package Quantity: 4000; Package Reference: 0805; Package Description: 2-Pin Surface Mount Device, Body 2 x1.25 mm; Tolerance: 25%
J2 = CMP-14818-000001-1: AUDIO JACK, 3.5 MM, RT, 4 CONDUC; Manufacturer: CUI; Conn Orientation: Horizontal; Current Rating: 1A; Number Of Contacts: 4; Voltage Rating: 12V; Package: SJ2-3574A-SMT-TR; Device Class L1: Connectors; Lead Free: Yes; Digikey Description: AUDIO JACK, 3.5 MM, RT, 4 CONDUC; Device Class L2: Audio / Video Connectors; ComponentLink2URL: https://www.cui.com/product/resource/sj2-357x-smt.pdf; Automotive: No; RoHS: TRUE; Height: 5.3mm; Temperature Range Low: -25°C; Category: Conn; Temperature: -25°C to +85°C; Octopart: https://octopart.com/sj2-3574a-smt-tr-cui-77838840; Device Class L3: unset; Contact Material: Silver; Manufacturer Part Number: SJ2-3574A-SMT-TR; Temperature Range High: +85°C; ComponentLink2Description: Datasheet
R17 = CMP-04015-032974-1: 1.5kΩ ±1% 0.063W, 1/16W Chip Resistor 0402 (1005 Metric) Moisture Resistant Thin Film
R18 R25 R26 R33 = CMP-009-00149-3: Chip Resistor, 10 kOhms, +/-1 %, 63 mW, -55 to 125 degC, 0402; Power: 63mW; Tolerance: 1%; Min Operating Temperature: -55°C; Case/Package: 0402; Max Operating Temperature: 155°C; Pins: 2
R19 R24 R27 R32 = CMP-009-00157-3: Chip Resistor, 1 kOhms, +/-5 %, 63 mW, -55 to 155 degC, 0402; Tolerance: 5%; Power: 63mW; Case/Package: 0402; Pins: 2; Min Operating Temperature: -55°C; Max Operating Temperature: 155°C
R20 R28 = CMP-009-00065-2: 100R 0.063W 1% 0402 (1005 Metric)  SMD; Power: 63mW; Tolerance: 1%; Case/Package: 0402; Pins: 2; Mounting Technology: SMT
R21 R29 = CMP-04015-052789-1: 1.45kΩ ±0.1% 0.063W, 1/16W Chip Resistor 0402 (1005 Metric) Moisture Resistant Thin Film
R22 R30 = CMP-04015-052789-1: Res Thick Film 0402 3.16K Ohm 1% 0.1W(1/10W) ±100ppm/C Pad SMD Automotive T/R
R23 R31 = CMP-009-00064-2: 100K 0.063W 1% 0402 (1005 Metric)  SMD; Power: 63mW; Case/Package: 0402; Mounting Technology: SMT; Pins: 2; Tolerance: 1%
T1 = CMP-199822-000006-1: RF Transformer Surface Mount 50Ω 4.5 to 3000 MHz; Manufacturer: Mini-Circuits; Insertion Loss: 0.18-3.02dB; Frequency: 4.5-3000MHz; Turns Ratio: 1:1; RoHS: TRUE; Temperature Range Low: -40°C; Manufacturer Part Number: TC1-1-13M+; Octopart: https://octopart.com/tc1-1-13m%2B-mini-circuits-3993639; Automotive: No; ComponentLink2URL: https://www.minicircuits.com/pdfs/TC1-1-13M+.pdf; Device Class L2: Transformers; Device Class L1: Passive Components; Lead Free: Yes; Device Class L3: unset; Category: Trans; Temperature Range High: +85°C; Package: 0; Footprint Url: https://www.minicircuits.com/case_style/AT224-1A.pdf; Temperature: -40°C to +85°C; Height: 4.06mm; ComponentLink2Description: Datasheet
U2 = CMP-0285-00050-1: 400 MHz to 6 GHz Quadrature Demodulator, CP-24-3, Pb-Free, 1500 Reel; Min RF Frequency (MHz): 400MHz; Output P1dB (dBm): 12; IQ Freq (MHz): 390MHz; Max RF Frequency (MHz): 6GHz; Amplitude Error (dB): 70mdB; IIP3 (+dBm): 22dBm; Phase Error (deg): 0.2Deg; ComponentLink1Description: Manufacturer URL; ComponentLink3URL: http://www.analog.com/static/imported-files/packages/56702234806764CP_24_3.pdf; DatasheetVersion: Rev. 0; PackageReference: CP-24-3; ComponentLink2Description: Datasheet; ComponentLink1URL: www.analog.com; ComponentLink2URL: http://www.analog.com/static/imported-files/data_sheets/ADL5380.pdf; PackageVersion: Jan-2005; PackageDescription: 24-Lead Lead Frame Chip Scale Package [LFCSP_VQ]; ComponentLink3Description: Package Specification; Code_JEDEC: MO-220-VGGD-8
U3 U4 = CMP-0359-00717-2: Dual Channel, Low Noise, High Speed Operational Amplifier, RRIO, 100 MHz Typical GBW, 25 V/us Typical SR, 2.5 to 12.6 V, 8-Pin SOP (MS8-8), Commercial, Pb-Free, Reel; Manufacturer: Linear Technology; Linear Technology Part Number: LT6203; Vos (mV) Guaranteed: 0.5; Vs Max (V): 12.6; GBW (MHz) Typical: 100; Vs Min (V): 2.5; Vos (mV) Typical: 0.1; SR (V/us) Typical: 25; Is (mA) Typical: 2.8; Channels (#): 2; PartNumber: LT6203CMS8#TRPBF; ComponentLink2Description: Datasheet; ComponentLink1Description: Manufacturer URL; ComponentLink3Description: Package Specification; PackageDescription: 8-Lead Plastic Small Outline, Body 3.9 x 4.9 mm, Pitch 1.27 mm; DatasheetVersion: Rev. D; RevisionNote: URLs updated; PackageReference: LT-MS8-8; Mounting Technology: Surface Mount; Packing: Reel; ComponentLink2URL: http://cds.linear.com/docs/en/datasheet/620234fd.pdf; ComponentLink1URL: http://www.linear.com/; RoHS: Pb-Free; PackageVersion: Rev G; ComponentLink3URL: http://cds.linear.com/docs/en/packaging/05081610_G_SO8.pdf; Type: VFB

## Sheet SDR_Power.SchDoc
size B; SheetNumber: 4; SheetTotal: 4
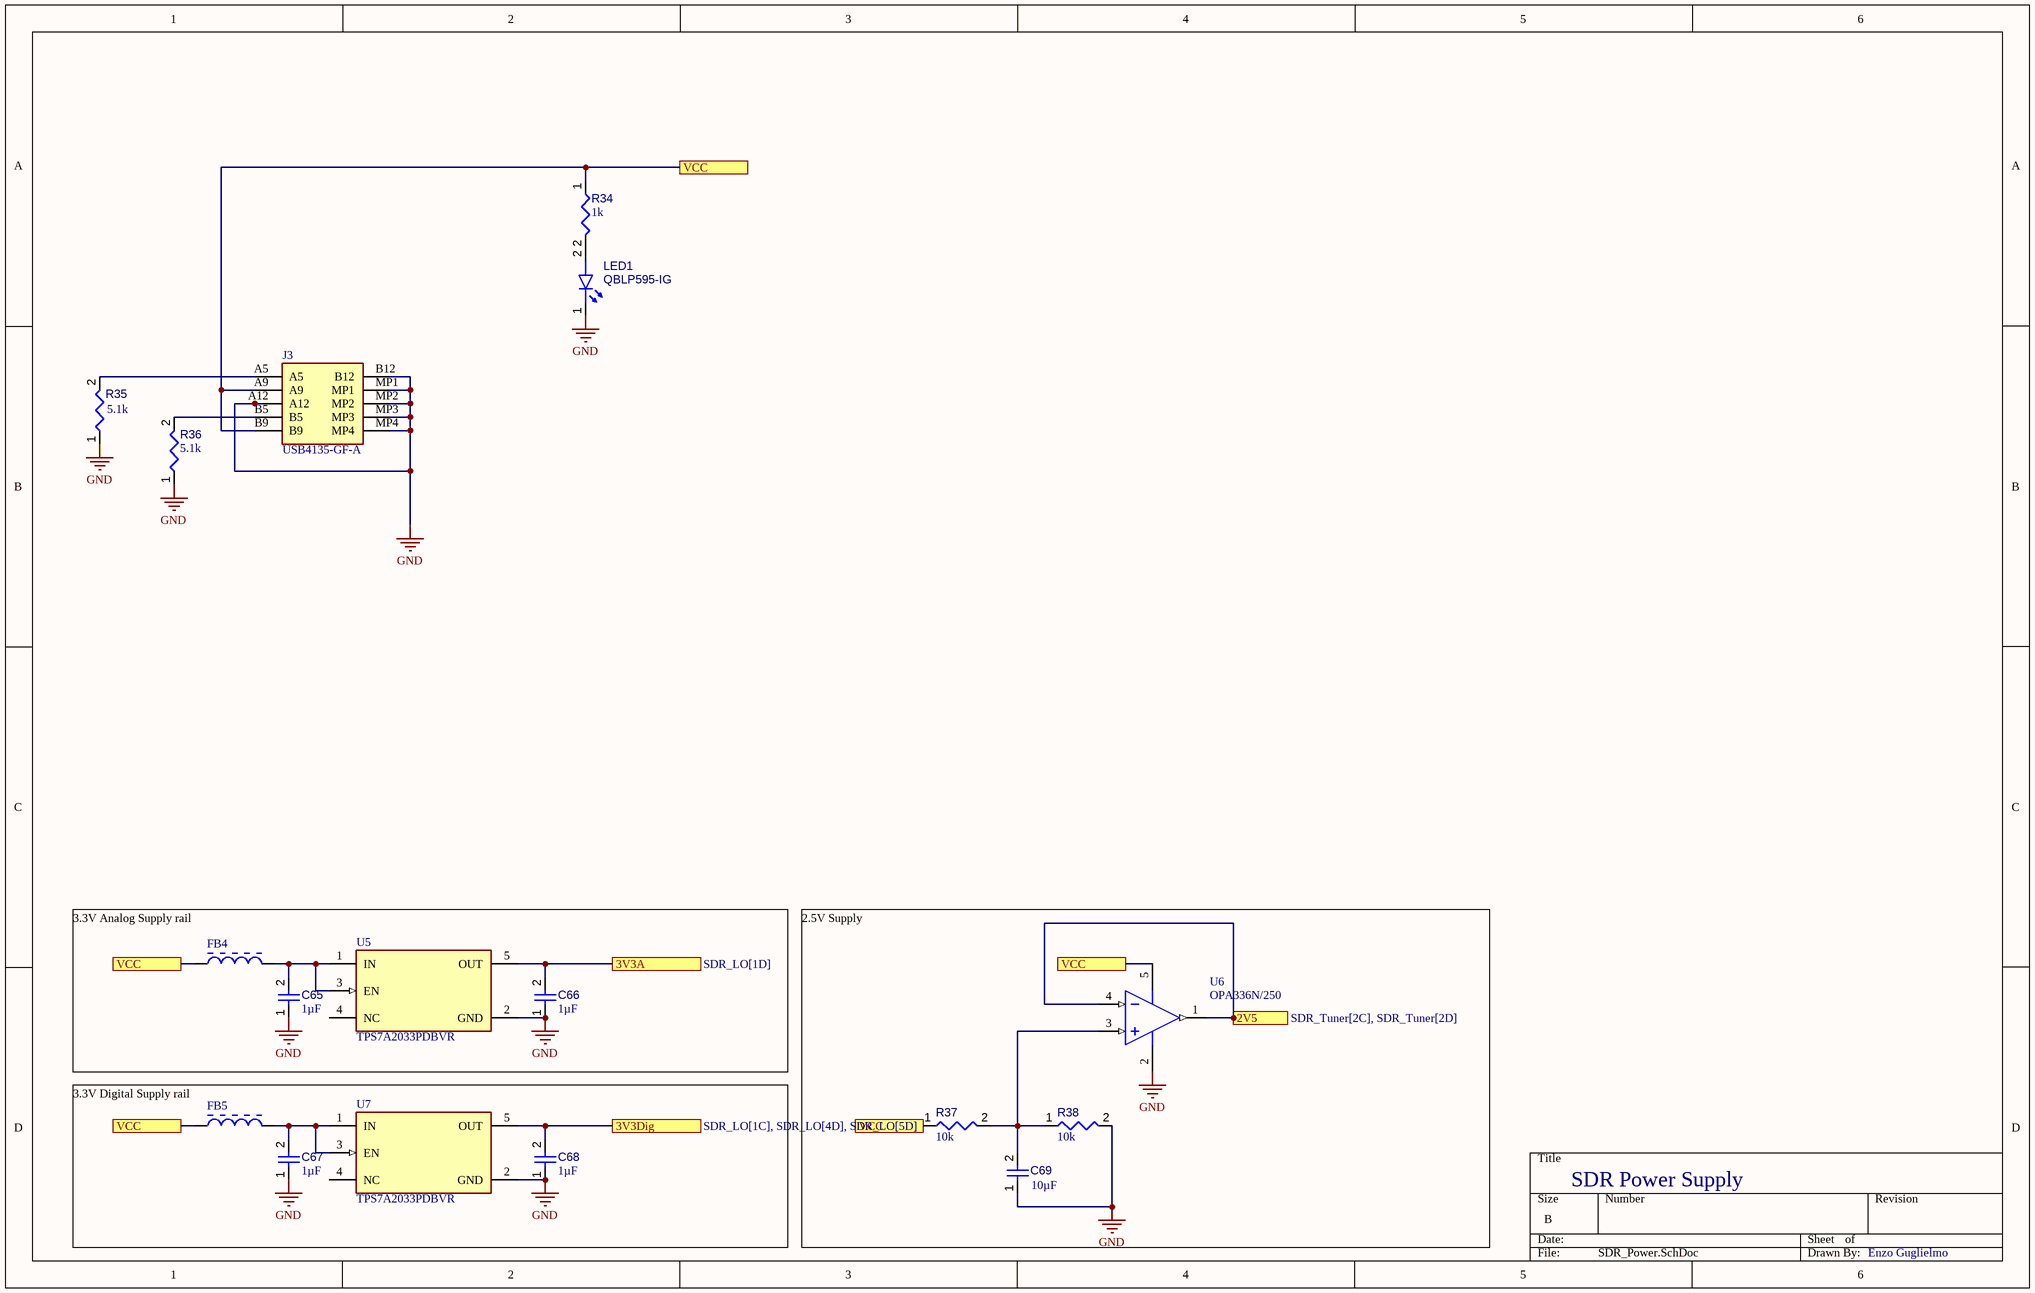
[diagram p3: SDR_Power.SchDoc]

### Parts
C65  value 1µF  [CAPC0402(1005)60_L]  (hidden comment: Capacitor 1µF +/-20% 10V 0402)
C66  value 1µF  [CAPC0402(1005)60_L]  (hidden comment: Capacitor 1µF +/-20% 10V 0402)
C67  value 1µF  [CAPC0402(1005)60_L]  (hidden comment: Capacitor 1µF +/-20% 10V 0402)
C68  value 1µF  [CAPC0402(1005)60_L]  (hidden comment: Capacitor 1µF +/-20% 10V 0402)
C69  value 10µF  [CAPC0402(1005)60_L]  (hidden comment: Capacitor 10µF +/-40% 6.3V 0402)
FB4  BLM21PG331SN1D  [INDC2013X105X50ML20T20]  (value not drawn)
FB5  BLM21PG331SN1D  [INDC2013X105X50ML20T20]  (value not drawn)
J3  USB4135-GF-A  [USB4135GFA]
LED1  QBLP595-IG  [QTB-QBLP595_V]
R34  value 1k  [RESC1005X40X25ML05T05]  (hidden comment: Resistor 100k +/-1% 0402 63 mW)
R35  value 5.1k  [RESC1005X40X25ML05T05]  (hidden comment: Resistor 100k +/-1% 0402 63 mW)
R36  value 5.1k  [RESC1005X40X25ML05T05]  (hidden comment: Resistor 100k +/-1% 0402 63 mW)
R37  value 10k  [RESC0402(1005)_L]  (hidden comment: 10KR2F)
R38  value 10k  [RESC0402(1005)_L]  (hidden comment: 10KR2F)
U5  TPS7A2033PDBVR  [FP-DBV0005A-MFG]
U6  OPA336N/250  [DBV0005A_M]
U7  TPS7A2033PDBVR  [FP-DBV0005A-MFG]

### Ports
2V5 (see SDR_Tuner[2C], SDR_Tuner[2D]), 3V3A (see SDR_LO[1D]), 3V3Dig (see SDR_LO[1C], SDR_LO[4D], SDR_LO[5D]), VCC (see SDR_FrontEnd[1C], SDR_Power[1C], SDR_Power[1D], SDR_Power[3A], SDR_Power[3D], SDR_Tuner[1B]), VCC (see SDR_FrontEnd[1C], SDR_Power[1C], SDR_Power[1D], SDR_Power[3A], SDR_Power[4C], SDR_Tuner[1B]), VCC (see SDR_FrontEnd[1C], SDR_Power[1C], SDR_Power[1D], SDR_Power[3D], SDR_Power[4C], SDR_Tuner[1B]), VCC (see SDR_FrontEnd[1C], SDR_Power[1C], SDR_Power[3A], SDR_Power[3D], SDR_Power[4C], SDR_Tuner[1B]), VCC (see SDR_FrontEnd[1C], SDR_Power[1D], SDR_Power[3A], SDR_Power[3D], SDR_Power[4C], SDR_Tuner[1B])

### Nets
GND: C65.1 C66.1 C67.1 C68.1 C69.1 J3.A12 J3.B12 J3.MP1 J3.MP2 J3.MP3 J3.MP4 LED1.1(K) R35.1 R36.1 R38.2 U5.2(GND) U6.2(V-) U7.2(GND)
NetC23_2: C68.2 U7.5(OUT) ; port 3V3Dig
NetC30_1: C66.2 U5.5(OUT) ; port 3V3A
NetC65_2: C65.2 FB4.2 U5.1(IN) U5.3(EN)
NetC67_2: C67.2 FB5.2 U7.1(IN) U7.3(EN)
NetC69_2: C69.2 R37.2 R38.1 U6.3(IN+)
NetFB1_1: FB4.1 FB5.1 J3.A9 J3.B9 R34.1 R37.1 U6.5(V+) ; port VCC
NetJ3_A5: J3.A5 R35.2
NetJ3_B5: J3.B5 R36.2
NetLED1_2: LED1.2(A) R34.2
NetR25_1: U6.1(OUT) U6.4(IN-) ; port 2V5

Not connected (* = marked no-connect by the designer): U5 4(NC); U7 4(NC)

### Notes on the sheet
- 3.3V Analog Supply rail
- 3.3V Digital Supply rail
- 2.5V Supply
- SDR Power Supply
- Enzo Guglielmo

### Library data of the parts
C65-C68 = CMP-001-00063-3: as C43 on sheet SDR_LO; Mounting Technology: SMT; Max Operating Temperature: 85°C; Voltage Rating: 10V; Pins: 2; Case/Package: 0402; Min Operating Temperature: -55°C
C69 = CMP-001-00074-3: as C57 on sheet SDR_Tuner; Case/Package: 0402; Pins: 2; Mounting Technology: SMT; Voltage Rating: 6.3V; Max Operating Temperature: 85°C; Min Operating Temperature: -55°C
FB4 FB5 = CMP-006-00000-3: as FB1 on sheet SDR_FrontEnd; Max Operating Temperature: 125°C; Core Material: Ferrite; Case/Package: 0805; Mounting Technology: SM; Datasheet URL: http://psearch.en.murata.com/inductor/product/LQG15HS15NJ02_.pdf; Packaging: TapeandReel; Min Operating Temperature: -55°C; RoHS Compliant: True; Max Current Rating: 1.5A; Datasheet Version: Nov-11; Package Quantity: 4000; Package Reference: 0805; Package Description: 2-Pin Surface Mount Device, Body 2 x1.25 mm; Tolerance: 25%
J3 = CMP-007-000000-1: USB Connectors USBC Rec GF RA 6P SMT-SMT stakes 3.16mm; Manufacturer_Name: GCT (GLOBAL CONNECTOR TECHNOLOGY); Geometry.Height: 3.5mm; Arrow Part Number: *; Manufacturer_Part_Number: USB4135-GF-A; Design Item ID: USB4135-GF-A; Mouser Price/Stock: https://www.mouser.co.uk/ProductDetail/GCT/USB4135-GF-A?qs=Li%252BoUPsLEnt6HRo6RUvaXA%3D%3D; Arrow Price/Stock: *; Source: USB4135-GF-A.SchLib; Datasheet Link: https://ar.mouser.com/datasheet/2/837/usb4135-2930399.pdf; Mouser Part Number: 640-USB4135-GF-A
LED1 = CMP-007-00041-3: Chip LED 0402, Green, 0.02 A, 3.1 to 3.7 V, -40 to 80 degC, 2-Pin SMD, RoHS, Tape and Reel; Case/Package: 0402; Colour: Green; Mounting Technology: SMT; Pins: 2; RoHS Compliant: Yes
R34-R36 = CMP-009-00021-5: as R1 on sheet SDR_FrontEnd; Pins: 2; Tolerance: 1%; Max Operating Temperature: 155°C; Case/Package: 0402; Min Operating Temperature: -55°C; Mounting Technology: SM; RoHS Compliant: True
R37 R38 = CMP-009-00066-2: 10K 0.063W 1% 0402 (1005 Metric)  SMD; Power: 63mW; Case/Package: 0402; Mounting Technology: SMT; Pins: 2; Tolerance: 1%
U5 U7 = CMP-04917-000300-1: IC REG LINEAR 3.3V 300MA SOT23-5; RoHS Compliant: Yes
U6 = CMP-014-00020-2: Single-Supply, MicroPower CMOS Operational Amplifier, 2.3 to 5.5 V, -55 to 125 degC, 5-Pin SOT23 (DBV5), Green (RoHS & no Sb/Br), Tape and Reel; Manufacturer: Texas Instruments (TI); Max Supply Voltage: 5V; Unity Gain Bandwidth Product: 100KHz; Slew Rate: 0.03V/us; Nominal Gain Bandwith Product: 11MHz; Common Mode Rejection Ratio: 80dB; Channels: 1; Max I/O Voltage: 125uV; Min Supply Voltage: 3V; Nominal Voltage Gain: 115dB; Nominal Supply Current: 32uA; Package Quantity: 250; Package Reference: DBV0005A; Datasheet URL: http://www.ti.com/general/docs/lit/getliterature.tsp?genericPartNumber=OPA336&fileType=pdf; Package Description: 5-Pin Small Outline Transistor, Body 2.9 x 1.6 mm, Pitch 0.95 mm; Datasheet Version: SBOS068C, 01/2005; Min Operating Temperature: -40°C; Package URL: http://www.ti.com/lit/ml/mpds018l/mpds018l.pdf; RoHS Compliant: True; Case/Package: SOT-23-5; Mounting Technology: SM; Pins: 5; Max Operating Temperature: 85°C; Packaging: TapeandReel; Manufacturer URL: http://www.ti.com/

## Nets that join several sheets
GND: SDR_FrontEnd (20 pins), SDR_LO (52 pins), SDR_Tuner (31 pins), SDR_Power (18 pins)
NetC11_2: SDR_LO (C11.2 L3.2), SDR_Tuner (U2.9)
NetC13_2: SDR_LO (C13.2 L2.2), SDR_Tuner (U2.10)
NetC23_2: SDR_LO (11 pins), SDR_Power (C68.2 U7.5)
NetC30_1: SDR_LO (12 pins), SDR_Power (C66.2 U5.5)
NetFB1_1: SDR_FrontEnd (FB1.1), SDR_Tuner (FB3.1), SDR_Power (7 pins)
NetMCU1_20: SDR_LO (MCU1.20 R14.2), SDR_Tuner (U2.7)
NetR25_1: SDR_Tuner (R25.1 R33.1), SDR_Power (U6.1 U6.4)
NetSAW2_4: SDR_FrontEnd (SAW2.4), SDR_Tuner (T1.6)